# Altium schematic sheet 5V_DUAL.schdoc
size 420 x 297 mm; Symbol: Sheet-Symbol_A2; Company: 嘉立创EDA; Version: V1.0; Page Size: A2; @Project Name: 【全网首发】X86电脑主板_copy; @Page Count: 30; @Update Date: 2025-10-09; @Create Date: 2025-10-09; @Schematic Name: SCHEMATIC1_1; @Page No: 0; @Page Name: 5V_DUAL; Device: Sheet-Symbol_A2; Border: 1; Width: 1655; Height: 1170; Region Start: 1; X Region Count: 6; Y Region Count: 4; Blade Width: 10; Title Block Position: 3
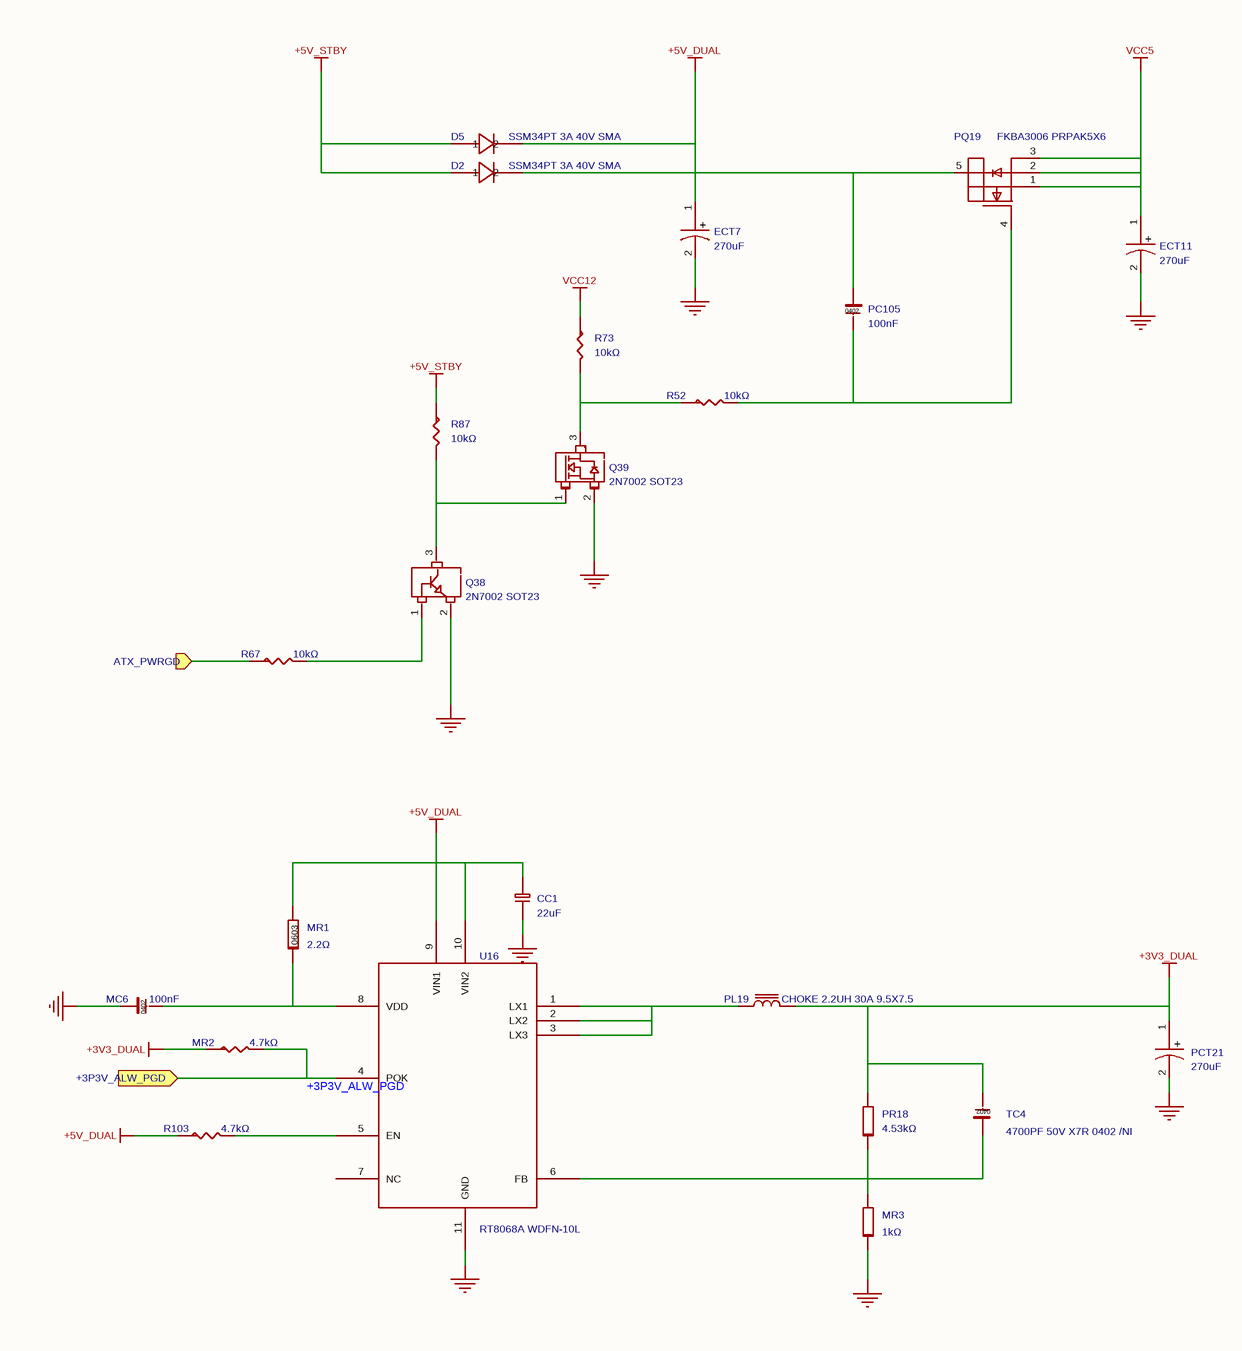
[diagram p0: 5V_DUAL.schdoc]

## Parts
CC1  22uF  [C0603_2]
D2  value SSM34PT 3A 40V SMA  [DIODE_1N5817_4148]  (hidden comment: SS34)
D5  value SSM34PT 3A 40V SMA  [DIODE_1N5817_4148]  (hidden comment: SS34)
ECT7  270uF  [EC1P25C_2]
ECT11  270uF  [EC1P25C_2]
MC6  100nF  [C0402_1]
MR1  2.2Ω  [R0603_1]
MR2  4.7kΩ  [R0402_1]
MR3  1kΩ  [R0402]
PC105  100nF  [C0402]
PCT21  270uF  [EC1P25C_2]
PL19  value CHOKE 2.2UH 30A 9.5X7.5  [CHOKE2U8-20A_3P]  (hidden comment: INDUCTOR_1)
PQ19  value FKBA3006 PRPAK5X6  [PRPAK5X6_1]  (hidden comment: PK616BA)
PR18  4.53kΩ  [R0402_2]
Q38  value 2N7002 SOT23  [SOT23_125]  (hidden comment: 2N7002)
Q39  value 2N7002 SOT23  [SOT-23-3_L2.9-W1.3-P1.90-LS2.4-BR]  (hidden comment: 2N7002)
R52  10kΩ  [R0402_1]
R67  10kΩ  [R0402_3]
R73  10kΩ  [R0402_3]
R87  10kΩ  [R0402_3]
R103  4.7kΩ  [R0402_3]
TC4  value 4700PF 50V X7R 0402 /NI  [C0402]  (hidden comment: C0402)
U16  value RT8068A WDFN-10L  [DFN3X3-10-0-5_1]  (hidden comment: RT8068AZQW)

## Ports
+3P3V_ALW_PGD (in), ATX_PWRGD (in)

## Nets
+3V3_DUAL: MR2.1 PCT21.1 PL19.2 PR18.2 TC4.2
+5V_DUAL: CC1.1 D2.2 D5.2 ECT7.1 MR1.2 PC105.1 PQ19.5(DRAIN1) R103.1 U16.9(VIN1) U16.10(VIN2)
+5V_STBY: D2.1 D5.1 R87.1
GND: CC1.2 ECT7.2 ECT11.2 MC6.1 MR3.1 PCT21.2 Q38.2(E) Q39.2(S) U16.11(GND)
VCC5: ECT11.1 PQ19.1(SOURCE1) PQ19.2(SOURCE2) PQ19.3(SOURCE3)
VCC12: R73.1
+3P3V_ALW_PGD: MR2.2 U16.4(POK) ; port +3P3V_ALW_PGD
ATX_PWRGD: R67.1 ; port ATX_PWRGD
NetMC6_2: MC6.2 MR1.1 U16.8(VDD)
NetMR3_2: MR3.2 PR18.1 TC4.1 U16.6(FB)
NetPC105_2: PC105.2 PQ19.4(GATE) R52.2
NetPL19_1: PL19.1 U16.1(LX1) U16.2(LX2) U16.3(LX3)
NetQ38_1: Q38.1(B) R67.2
NetQ38_3: Q38.3(C) Q39.1(G) R87.2
NetQ39_3: Q39.3(D) R52.1 R73.2
NetR103_2: R103.2 U16.5(EN)

Not connected (* = marked no-connect by the designer): U16 7(NC)

## Notes on the sheet
- 更新日期
- 2025-10-09
- 原理图
- 图页
- SCHEMATIC1_1
- 5V_DUAL
- 创建日期
- 物料编码
- 审阅
- 绘制
- 【全网首发】X86电脑主板_copy
- 版本
- V1.0
- 尺寸
- A2
- 页
- 0
- 嘉立创EDA
- 共
- 30
- 1
- (in symbol 160AREC271M0609) +

## Library data of the parts
CC1 = CL10A226MQ8NRNC_1: 容值:22uF;精度:±20%;额定电压:6.3V;材质(温度系数):X5R;; Manufacturer: SAMSUNG(三星); 3D Model: ac125912035d415993ca9572d50418b1; Symbol: CAP; PCB Footprint: C0603; Tolerance: ±20%; AddInBom: yes; Voltage Rated: 6.3V; ModelName: C0603_L1.6-W0.8-H0.8; ModelTransform: 62.992,31.496,0,0,0,0,0,0,0; Temperature Coefficient: X5R; Device: CL10A226MQ8NRNC_1; Value: 22uF; Supplier: LCSC; Datasheet: https://atta.szlcsc.com/upload/public/pdf/source/20160103/1457707740762.pdf; FootprintName: C0603_2; SupplierPart: C59461; ConvertToPcb: yes; LCSC Part Name: 22uF ±20% 6.3V; JLCPCB Part Class: Basic Part; ManufacturerPart: CL10A226MQ8NRNC; Supplier Footprint: 0603
D2 D5 = SS34_C727060: 二极管配置:独立式;正向压降(Vf):550mV@3A;直流反向耐压(Vr):40V;平均整流电流(Io):3A;; Manufacturer: TWGMC(台湾迪嘉); Symbol: 1N4148_0; AddInBom: yes; ModelId: 5b53cc1b87a148cc9fa13125be89f948; ModelName: SMA_L4.3-W2.5-LS5.0-RD; ModelTransform: 194.8815,98.425,0,0,0,0,0,0,0; Diode Configuration: 独立式; Reverse Voltage (Vr): 40V; Average Rectified Current (Io): 3A; Reverse Leakage Current (Ir): 500uA@40V; Device: SS34_C727060; LCSC Part Name: 电压:40V 电流:3A; SupplierPart: C727060; ManufacturerPart: SS34; Supplier Footprint: SMA(DO-214AC); JLCPCB Part Class: Extended Part; Datasheet: https://atta.szlcsc.com/upload/public/pdf/source/20200828/C727059_6599B6CAC5F3238B9C33E46794659DBE.pdf; Supplier: LCSC; ConvertToPcb: yes; FootprintName: DIODE_1N5817_4148; Forward Voltage (Vf@If): 550mV@3A
ECT7 ECT11 PCT21 = 160AREC271M0609: 容值:270uF;精度:±20%;额定电压:16V;纹波电流:3.8A@100kHz;等效串联电阻:15mΩ@100kHz~300kHz;类型:-;; Manufacturer: APAQ(钰邦); Symbol: CAPACITOR POL_0; AddInBom: yes; ModelId: 0a4db4bf24b443b3be4905be97ff10c5; ModelName: CAP-TH_BD6.3-P2.50-D1.0-FD; ModelTransform: 248.4247,247.99777,0,0,0,0,0,0,-137.795; Tolerance: ±20%; Rated Voltage: 16V; φD: 6.3mm; L: 9mm; Lifetime @ Temp: 2000hrs@105℃; Device: 160AREC271M0609; Value: 270uF; LCSC Part Name: 270uF ±20% 16V; SupplierPart: C176312; ManufacturerPart: 160AREC271M0609; Supplier Footprint: 插件,D6.3xL9mm; JLCPCB Part Class: Extended Part; Datasheet: https://atta.szlcsc.com/upload/public/pdf/source/20180420/C176312_A6CC051F3F5535015096354530D22B11.pdf; Supplier: LCSC; ConvertToPcb: yes; FootprintName: EC1P25C_2; Ripple Current: 3.8A@100kHz; Equivalent Series Resistance(ESR): 15mΩ@100kHz~300kHz; Type: -; Lead Spacing: 2.5mm; Operating Temperature: -55℃~+105℃
MC6 = CL05B104KO5NNNC: 容值:100nF;精度:±10%;额定电压:16V;材质(温度系数):X7R;; Manufacturer: SAMSUNG(三星); Symbol: C0402; ModelId: 36a51122f27c49738f86b3bfa98863e0; Tolerance: ±10%; AddInBom: yes; Voltage Rated: 16V; ModelName: C0402_L1.0-W0.5-H0.5; ModelTransform: 39.37,19.685,0,0,0,0,0,0,0; Temperature Coefficient: X7R; Device: CL05B104KO5NNNC; Value: 100nF; Supplier: LCSC; Datasheet: https://atta.szlcsc.com/upload/public/pdf/source/20160103/1457707674891.pdf; FootprintName: C0402_1; SupplierPart: C1525; ConvertToPcb: yes; LCSC Part Name: 100nF ±10% 16V; JLCPCB Part Class: Basic Part; ManufacturerPart: CL05B104KO5NNNC; Supplier Footprint: 0402
MR1 = 0603WAF220KT5E: 电阻类型:厚膜电阻;阻值:2.2Ω;精度:±1%;功率:100mW;; Manufacturer: UNI-ROYAL(厚声); Symbol: R0603; ModelId: fc143cca1e79419f9cd78b61e9279f08; Tolerance: ±1%; AddInBom: yes; Power(Watts): 100mW; ModelTransform: 31.8897,63.7794,0,90,0,0,0,0,0; Overload Voltage (Max): 75V; Temperature Coefficient: ±400ppm/℃; Device: 0603WAF220KT5E; Value: 2.2Ω; Type: 厚膜电阻; Supplier: LCSC; Datasheet: https://atta.szlcsc.com/upload/public/pdf/source/20200306/C422600_1E6D84923E4A46A82E41ADD87F860B5C.pdf; FootprintName: R0603_1; SupplierPart: C22939; ModelName: R0603; ConvertToPcb: yes; LCSC Part Name: 2.2Ω ±1% 100mW; JLCPCB Part Class: Basic Part; ManufacturerPart: 0603WAF220KT5E; Supplier Footprint: 0603; Operating Temperature Range: -55℃~+155℃
MR2 = 0402WGF4701TCE: 电阻类型:厚膜电阻;阻值:4.7kΩ;精度:±1%;功率:62.5mW;; Manufacturer: UNI-ROYAL(厚声); Symbol: R-0603_0; ModelId: 671aefced39d4c318694bba8bd8efd39; Tolerance: ±1%; AddInBom: yes; Power(Watts): 62.5mW; ModelName: R0402_L1.0-W0.5-H0.5; ModelTransform: 39.37,19.685,0,0,0,0,0,0.0005,0; Overload Voltage (Max): 50V; Temperature Coefficient: ±100ppm/℃; Device: 0402WGF4701TCE; Value: 4.7kΩ; Type: 厚膜电阻; Supplier: LCSC; Datasheet: https://atta.szlcsc.com/upload/public/pdf/source/20200306/C422600_1E6D84923E4A46A82E41ADD87F860B5C.pdf; FootprintName: R0402_1; SupplierPart: C25900; ConvertToPcb: yes; LCSC Part Name: 4.7kΩ ±1% 62.5mW; JLCPCB Part Class: Basic Part; ManufacturerPart: 0402WGF4701TCE; Supplier Footprint: 0402; Operating Temperature Range: -55℃~+155℃
MR3 = 0402WGF1001TCE: 电阻类型:厚膜电阻;阻值:1kΩ;精度:±1%;功率:62.5mW;; Manufacturer: UNI-ROYAL(厚声); ModelId: 671aefced39d4c318694bba8bd8efd39; Tolerance: ±1%; AddInBom: yes; Power(Watts): 62.5mW; ModelName: R0402_L1.0-W0.5-H0.5; ModelTransform: 39.37,19.685,0,0,0,0,0,0.0005,0; Overload Voltage (Max): 50V; Temperature Coefficient: ±100ppm/℃; Device: 0402WGF1001TCE; Symbol: R0402; Value: 1kΩ; Type: 厚膜电阻; Supplier: LCSC; Datasheet: https://atta.szlcsc.com/upload/public/pdf/source/20200306/C422600_1E6D84923E4A46A82E41ADD87F860B5C.pdf; FootprintName: R0402; SupplierPart: C11702; ConvertToPcb: yes; LCSC Part Name: 1kΩ ±1% 62.5mW; JLCPCB Part Class: Basic Part; ManufacturerPart: 0402WGF1001TCE; Supplier Footprint: 0402; Operating Temperature Range: -55℃~+155℃
PC105 = CL05B104KO5NNNC: 容值:100nF;精度:±10%;额定电压:16V;材质(温度系数):X7R;; Manufacturer: SAMSUNG(三星); ModelId: 36a51122f27c49738f86b3bfa98863e0; Tolerance: ±10%; AddInBom: yes; Voltage Rated: 16V; ModelName: C0402_L1.0-W0.5-H0.5; ModelTransform: 39.37,19.685,0,0,0,0,0,0,0; Temperature Coefficient: X7R; Device: CL05B104KO5NNNC; Symbol: C0402; Value: 100nF; Supplier: LCSC; Datasheet: https://atta.szlcsc.com/upload/public/pdf/source/20160103/1457707674891.pdf; FootprintName: C0402; SupplierPart: C1525; ConvertToPcb: yes; LCSC Part Name: 100nF ±10% 16V; JLCPCB Part Class: Basic Part; ManufacturerPart: CL05B104KO5NNNC; Supplier Footprint: 0402
PL19 = INDUCTOR_1: 2R8 一体成型直插电感; Check: false; AddInBom: yes; Device: INDUCTOR_1; Symbol: INDUCTOR_1; FootprintName: CHOKE2U8-20A_3P; ConvertToPcb: yes
PQ19 = PK616BA: 类型:1个N沟道;漏源电压(Vdss):30V;连续漏极电流(Id):50A;功率(Pd):31W;导通电阻(RDS(on)@Vgs,Id):9.5mΩ@4.5V,13A;阈值电压(Vgs(th)@Id):3V@250uA;; Manufacturer: NIKO-SEM(尼克森); Symbol: MOS-N_SO8_1; AddInBom: yes; ModelId: 178189b27e7544aca50c111426555358; ModelName: PDFN-8_L4.9-W5.8-H1.0-P1.27; ModelTransform: 200.787,240.157,0,0,0,0,-0.097,0,0; Drain Source Voltage (Vdss): 30V; Continuous Drain Current (Id): 50A; Power Dissipation (Pd): 31W; Device: PK616BA; LCSC Part Name: 1个N沟道 耐压:30V 电流:50A; SupplierPart: C133608; ManufacturerPart: PK616BA; Supplier Footprint: PDFN-8(5.8x4.9); JLCPCB Part Class: Extended Part; Datasheet: https://atta.szlcsc.com/upload/public/pdf/source/20170930/C133608_1506736454344997453.pdf; Supplier: LCSC; ConvertToPcb: yes; FootprintName: PRPAK5X6_1; Type: 1个N沟道; Drain Source On Resistance (RDS(on)@Vgs,Id): 9.5mΩ@4.5V,13A; Gate Threshold Voltage (Vgs(th)@Id): 3V@250uA
PR18 = RC0402FR-074K53L: 电阻类型:厚膜电阻;阻值:4.53kΩ;精度:±1%;功率:62.5mW;; Manufacturer: YAGEO(国巨); Symbol: R0402; ModelId: 671aefced39d4c318694bba8bd8efd39; Tolerance: ±1%; AddInBom: yes; Power(Watts): 62.5mW; ModelName: R0402_L1.0-W0.5-H0.5; ModelTransform: 39.37,19.685,0,0,0,0,0,0.0005,0; Overload Voltage (Max): 50V; Temperature Coefficient: ±100ppm/℃; Device: RC0402FR-074K53L; Value: 4.53kΩ; Type: 厚膜电阻; Supplier: LCSC; Datasheet: https://atta.szlcsc.com/upload/public/pdf/source/20180904/C276271_6CDD8B95D1A0F3B937C2E6718EE36455.pdf; FootprintName: R0402_2; SupplierPart: C276271; ConvertToPcb: yes; LCSC Part Name: 4.53kΩ ±1% 62.5mW; JLCPCB Part Class: Extended Part; ManufacturerPart: RC0402FR-074K53L; Supplier Footprint: 0402; Operating Temperature Range: -55℃~+155℃
Q38 = 2N7002_C916396: 类型:1个N沟道;漏源电压(Vdss):60V;连续漏极电流(Id):115mA;功率(Pd):200mW;导通电阻(RDS(on)@Vgs,Id):1.2Ω@10V,500mA;阈值电压(Vgs(th)@Id):2.1V@250uA;; Manufacturer: JSMSEMI(杰盛微); Symbol: 2N3904_0; AddInBom: yes; ModelId: c62791f0466c4ae2a892c056b845b0ca; ModelName: SOT-23-3P_L2.9-W1.3-H1.0-LS2.4-P0.95; ModelTransform: 98.425,114.173,0,180,0,0,0.0005,-0.0005,0; Type: 1个N沟道; Drain Source Voltage (Vdss): 60V; Continuous Drain Current (Id): 115mA; Power Dissipation (Pd): 200mW; Input Capacitance (Ciss@Vds): 20pF@25V; Reverse Transfer Capacitance (Crss@Vds): 4pF@25V; Device: 2N7002_C916396; LCSC Part Name: 1个N沟道 耐压:60V 电流:115mA; SupplierPart: C916396; ManufacturerPart: 2N7002; Supplier Footprint: SOT-23; JLCPCB Part Class: Extended Part; Datasheet: https://atta.szlcsc.com/upload/public/pdf/source/20230714/89F30C6A193AD72E5F1F14B53E304F4A.pdf; Supplier: LCSC; ConvertToPcb: yes; FootprintName: SOT23_125; Drain Source On Resistance (RDS(on)@Vgs,Id): 1.2Ω@10V,500mA; Gate Threshold Voltage (Vgs(th)@Id): 2.1V@250uA; Total Gate Charge (Qg@Vgs): -; Operating Temperature: -
Q39 = 2N7002_C8545: 类型:N沟道;漏源电压(Vdss):60V;连续漏极电流(Id):115mA;功率(Pd):200mW;导通电阻(RDS(on)@Vgs,Id):7.5Ω@10V,500mA;阈值电压(Vgs(th)@Id):2.5V@250uA;; Manufacturer: CJ(江苏长电/长晶); Symbol: 2N7002-N_0; Type: N沟道; ModelId: c62791f0466c4ae2a892c056b845b0ca; AddInBom: yes; ModelName: SOT-23-3P_L2.9-W1.3-H1.0-LS2.4-P0.95; ModelTransform: 98.425,114.173,0,180,0,0,0.0005,-0.0005,0; Power Dissipation (Pd): 200mW; Drain Source Voltage (Vdss): 60V; Continuous Drain Current (Id): 115mA; Device: 2N7002_C8545; Supplier: LCSC; Datasheet: https://atta.szlcsc.com/upload/public/pdf/source/20170302/1488422688078.pdf; FootprintName: SOT-23-3_L2.9-W1.3-P1.90-LS2.4-BR; SupplierPart: C8545; ConvertToPcb: yes; LCSC Part Name: N沟道 60V 115mA; JLCPCB Part Class: Basic Part; ManufacturerPart: 2N7002; Supplier Footprint: SOT-23; Gate Threshold Voltage (Vgs(th)@Id): 2.5V@250uA; Drain Source On Resistance (RDS(on)@Vgs,Id): 7.5Ω@10V,500mA
R52 R67 R73 R87 = 0402WGF1002TCE: 电阻类型:厚膜电阻;阻值:10kΩ;精度:±1%;功率:62.5mW;; Manufacturer: UNI-ROYAL(厚声); Symbol: R-0603_0; ModelId: 671aefced39d4c318694bba8bd8efd39; Tolerance: ±1%; AddInBom: yes; Power(Watts): 62.5mW; ModelName: R0402_L1.0-W0.5-H0.5; ModelTransform: 39.37,19.685,0,0,0,0,0,0.0005,0; Overload Voltage (Max): 50V; Temperature Coefficient: ±100ppm/℃; Device: 0402WGF1002TCE; Value: 10kΩ; Type: 厚膜电阻; Supplier: LCSC; Datasheet: https://atta.szlcsc.com/upload/public/pdf/source/20200306/C422600_1E6D84923E4A46A82E41ADD87F860B5C.pdf; SupplierPart: C25744; ConvertToPcb: yes; LCSC Part Name: 10kΩ ±1% 62.5mW; JLCPCB Part Class: Basic Part; ManufacturerPart: 0402WGF1002TCE; Supplier Footprint: 0402; Operating Temperature Range: -55℃~+155℃
  R52: FootprintName: R0402_1
  R67 R73 R87: FootprintName: R0402_3
R103 = 0402WGF4701TCE: 电阻类型:厚膜电阻;阻值:4.7kΩ;精度:±1%;功率:62.5mW;; Manufacturer: UNI-ROYAL(厚声); Symbol: R; ModelId: 671aefced39d4c318694bba8bd8efd39; Tolerance: ±1%; AddInBom: yes; Power(Watts): 62.5mW; ModelName: R0402_L1.0-W0.5-H0.5; ModelTransform: 39.37,19.685,0,0,0,0,0,0.0005,0; Overload Voltage (Max): 50V; Temperature Coefficient: ±100ppm/℃; Device: 0402WGF4701TCE; Value: 4.7kΩ; Type: 厚膜电阻; Supplier: LCSC; Datasheet: https://atta.szlcsc.com/upload/public/pdf/source/20200306/C422600_1E6D84923E4A46A82E41ADD87F860B5C.pdf; FootprintName: R0402_3; SupplierPart: C25900; ConvertToPcb: yes; LCSC Part Name: 4.7kΩ ±1% 62.5mW; JLCPCB Part Class: Basic Part; ManufacturerPart: 0402WGF4701TCE; Supplier Footprint: 0402; Operating Temperature Range: -55℃~+155℃
TC4 = C0402: Manufacturer: FH(风华); Manufacturer Part: 0402B472K500NT; 3D Model Transform: 39.37,19.685,0,0,0,0,0,0,0; Tolerance: ±10%; Voltage Rated: 50V; Temperature Coefficient: X7R; ModelId: 222a10e09e6e477a9f85628e277082cb; AddInBom: yes; Device: C0402; Symbol: C0402; LCSC Part Name: 4.7nF ±10% 50V; Supplier Part: C1538; Supplier Footprint: 0402; JLCPCB Part Class: Basic Part; Datasheet: https://atta.szlcsc.com/upload/public/pdf/source/20200305/C486355_26A10D38EF8C2A5C37091D0039909270.pdf; Supplier: LCSC; FootprintName: C0402; ModelName: C0402; ConvertToPcb: yes
U16 = RT8068AZQW: 功能类型:降压型;输入电压:-;输出电流(最大值):-;; Manufacturer: RICHTEK(立锜); Symbol: uP6305 PSOP8_1; AddInBom: yes; ModelId: fa41748ee6fa4796aafe6110ca106f1f; ModelName: WDFN-10_L3.0-W3.0-H0.8-P0.50; ModelTransform: 118.11,118.8974,0,0,0,0,0,0,0; Function: 降压型; Switch tube (built-in/external): 内置; Device: RT8068AZQW; LCSC Part Name: RT8068AZQW; SupplierPart: C55803; ManufacturerPart: RT8068AZQW; Supplier Footprint: WDFN-10-EP(3x3); JLCPCB Part Class: Extended Part; Datasheet: https://atta.szlcsc.com/upload/public/pdf/source/20171129/C55803_15119540043011151371.pdf; Supplier: LCSC; ConvertToPcb: yes; FootprintName: DFN3X3-10-0-5_1; Input Voltage: -; Output Current (Max): -; Switching Frequency: -; Synchronous Rectification: -; Number of Outputs: -; Topology: -